# Altium project Bio-Tracking-Device.PrjPcb (part 2 of 4)

## Sheet GSM-Sheet.SchDoc
size 420 x 297 mm; SheetNumber: 5; SheetTotal: 6
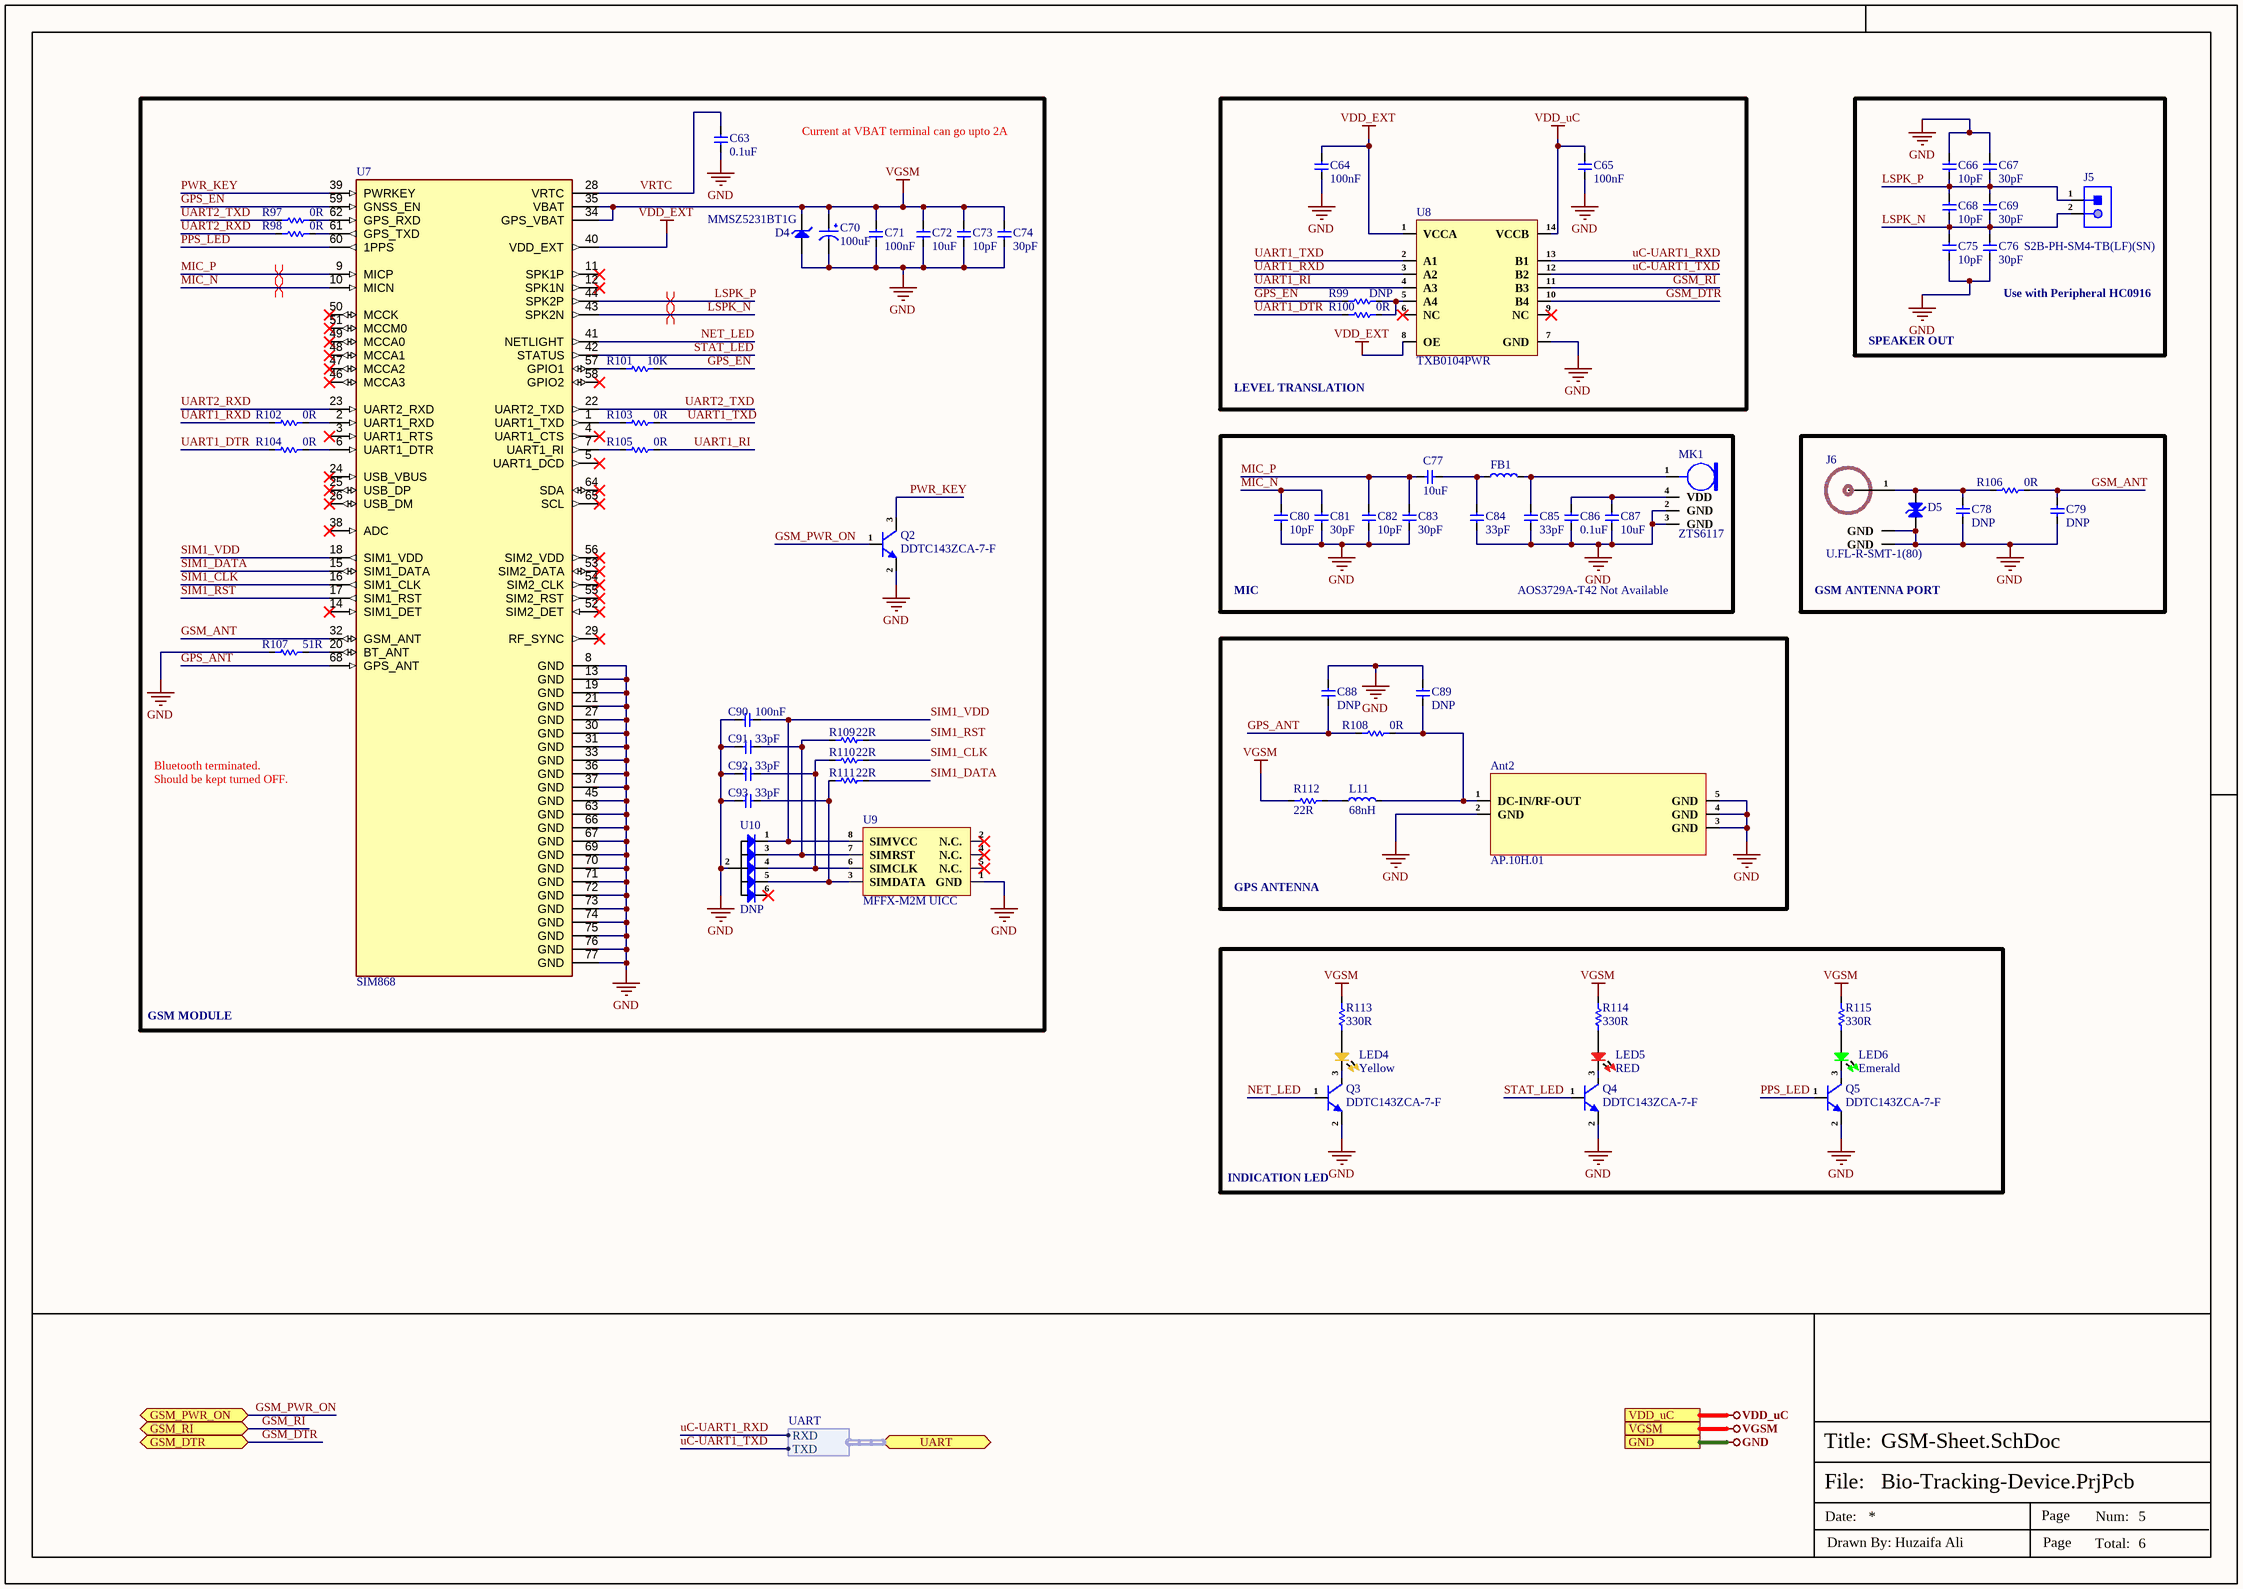
[diagram p2: GSM-Sheet.SchDoc]

### Parts
Ant2  AP.10H.01  [AP.10H.01]
C63  0.1uF  [Cap-0402]
C64  100nF  [Cap-0402]
C65  100nF  [Cap-0402]
C66  10pF  [Cap-0402]
C67  30pF  [Cap-0402]
C68  10pF  [Cap-0402]
C69  30pF  [Cap-0402]
C70  100uF  [Case-B]
C71  100nF  [Cap-0402]
C72  10uF  [CAP-0603]
C73  10pF  [Cap-0402]
C74  30pF  [Cap-0402]
C75  10pF  [Cap-0402]
C76  30pF  [Cap-0402]
C77  10uF  [Cap-0402]
C78  DNP  [CAP-0201]
C79  DNP  [CAP-0201]
C80  10pF  [Cap-0402]
C81  30pF  [Cap-0402]
C82  10pF  [Cap-0402]
C83  30pF  [Cap-0402]
C84  33pF  [Cap-0402]
C85  33pF  [Cap-0402]
C86  0.1uF  [Cap-0402]
C87  10uF  [Cap-0402]
C88  DNP  [CAP-0201]
C89  DNP  [CAP-0201]
C90  100nF  [Cap-0402]
C91  33pF  [Cap-0402]
C92  33pF  [Cap-0402]
C93  33pF  [Cap-0402]
D4  MMSZ5231BT1G  [SOD-123]
D5  LXES15AAA1-153  [DFN1006-2L (Bi-Directional)]  (value not drawn)
FB1  100MHz  [IND-0402]  (value not drawn)
J5  S2B-PH-SM4-TB(LF)(SN)  [S2B-PH-SM4-TB(LF)(SN)]
J6  U.FL-R-SMT-1(80)  [U.FL-R-SMT-1(80)_]
L11  68nH  [IND-0603 (1608 Metric)]
LED4  Yellow  [LED-0603]
LED5  RED  [LED-0603]
LED6  Emerald  [LED-0603]
MK1  ZTS6117  [ZTS6117_]
Q2  DDTC143ZCA-7-F  [SOT-23]
Q3  DDTC143ZCA-7-F  [SOT-23]
Q4  DDTC143ZCA-7-F  [SOT-23]
Q5  DDTC143ZCA-7-F  [SOT-23]
R97  0R  [Res-0201]
R98  0R  [Res-0201]
R99  DNP  [Res-0402]
R100  0R  [Res-0201]
R101  10K  [Res-0402]
R102  0R  [Res-0201]
R103  0R  [Res-0201]
R104  0R  [Res-0201]
R105  0R  [Res-0201]
R106  0R  [Res-0201]
R107  51R  [RES-0805]
R108  0R  [Res-0201]
R109  22R  [Res-0402]
R110  22R  [Res-0402]
R111  22R  [Res-0402]
R112  22R  [Res-0402]
R113  330R  [Res-0402]
R114  330R  [Res-0402]
R115  330R  [Res-0402]
U7  SIM868  [XCVR_SIM868]
U8  TXB0104PWR  [14-TSSOP]
U9  MFFX-M2M UICC  [MFFX]
U10  DNP  [SOT-363]

### Blocks framed on the sheet
LEVEL TRANSLATION: C64 C65 R99 R100 U8
GSM ANTENNA PORT: C78 C79 D5 J6 R106
GPS ANTENNA: Ant2 C88 C89 L11 R108 R112
INDICATION LED: LED4-LED6 Q3-Q5 R113-R115

### Ports
GND (see Top-Sheet[2B], Controller-Sheet[5D], Power-Sheet[5D], Sensor-Sheet[5D], Temp-Sensor-Sheet[3D]), GSM_DTR (bidir, see Top-Sheet[2B], Controller-Sheet[1D]), GSM_PWR_ON (bidir, see Top-Sheet[2B], Controller-Sheet[1D]), GSM_RI (bidir, see Top-Sheet[2B], Controller-Sheet[1D]), UART (bidir, harness UART, see Top-Sheet[2B], Controller-Sheet[4D]), VDD_uC (see Top-Sheet[2B], Controller-Sheet[5D], Power-Sheet[5D]), VGSM (see Top-Sheet[2B], Power-Sheet[5D])

### Harnesses
UART: RXD, TXD

### Nets
GND: Ant2.2(GND) Ant2.3(GND) Ant2.4(GND) Ant2.5(GND) C63.1 C64.1 C65.1 C66.2 C67.2 C70.2 C71.1 C72.1 C73.1 C74.1 C75.1 C76.1 C78.1 C79.1 C80.1 C81.1 C82.1 C83.1 C84.1 C85.1 C86.1 C87.1 C88.2 C89.2 C90.1 C91.2 C92.2 C93.2 D4.1(A) D5.1(A) J6.2(GND) J6.3(GND) MK1.2(GND) MK1.3(GND) Q2.2(E) Q3.2(E) Q4.2(E) Q5.2(E) R107.1 U7.8(GND) U7.13(GND) U7.19(GND) U7.21(GND) U7.27(GND) U7.30(GND) U7.31(GND) U7.33(GND) U7.36(GND) U7.37(GND) U7.45(GND) U7.63(GND) U7.66(GND) U7.67(GND) U7.69(GND) U7.70(GND) U7.71(GND) U7.72(GND) U7.73(GND) U7.74(GND) U7.75(GND) U7.76(GND) U7.77(GND) U8.7(GND) U9.1(GND) U10.2(A) ; port GND
VDD_EXT: C64.2 U7.40(VDD_EXT) U8.1(VCCA) U8.8(OE)
VDD_uC: C65.2 U8.14(VCCB) ; port VDD_uC
VGSM: C70.1 C71.2 C72.2 C73.2 C74.2 D4.2(K) R112.1 R113.2 R114.2 R115.2 U7.34(GPS_VBAT) U7.35(VBAT) ; port VGSM
GPS_ANT: C88.1 R108.1 U7.68(GPS_ANT)
GPS_EN: R99.1 R101.2 U7.59(GNSS_EN)
GSM_ANT: C79.2 R106.2 U7.32(GSM_ANT)
GSM_DTR: U8.10(B4) ; port GSM_DTR
GSM_PWR_ON: Q2.1(B) ; port GSM_PWR_ON
GSM_RI: U8.11(B3) ; port GSM_RI
LSPK_N: C68.1 C69.1 C75.2 C76.2 J5.2 U7.43(SPK2N)
LSPK_P: C66.1 C67.1 C68.2 C69.2 J5.1 U7.44(SPK2P)
MIC_N: C80.2 C81.2 U7.10(MICN)
MIC_P: C77.2 C82.2 C83.2 U7.9(MICP)
NET_LED: Q3.1(B) U7.41(NETLIGHT)
PPS_LED: Q5.1(B) U7.60(1PPS)
PWR_KEY: Q2.3(C) U7.39(PWRKEY)
SIM1_CLK: R110.2 U7.16(SIM1_CLK)
SIM1_DATA: R111.2 U7.15(SIM1_DATA)
SIM1_RST: R109.2 U7.17(SIM1_RST)
SIM1_VDD: C90.2 U7.18(SIM1_VDD) U9.8(SIMVCC) U10.1(IO1)
STAT_LED: Q4.1(B) U7.42(STATUS)
UART1_DTR: R100.1 R104.1
UART1_RI: R105.2 U8.4(A3)
UART1_RXD: R102.1 U8.3(A2)
UART1_TXD: R103.2 U8.2(A1)
UART2_RXD: R98.1 U7.23(UART2_RXD)
UART2_TXD: R97.1 U7.22(UART2_TXD)
uC-UART1_RXD: U8.13(B1) ; port UART.RXD
uC-UART1_TXD: U8.12(B2) ; port UART.TXD
VRTC: C63.2 U7.28(VRTC)
NetAnt2_1: Ant2.1(DC-IN/RF-OUT) C89.1 L11.2 R108.2
NetC77_1: C77.1 C84.2 FB1.1
NetC78_2: C78.2 D5.2(A) J6.1(RF_IN) R106.1
NetC85_2: C85.2 FB1.2 MK1.1(OUT)
NetC86_2: C86.2 C87.2 MK1.4(VDD)
NetC91_1: C91.1 R109.1 U9.7(SIMRST) U10.3(IO2)
NetC92_1: C92.1 R110.1 U9.6(SIMCLK) U10.4(IO3)
NetC93_1: C93.1 R111.1 U9.3(SIMDATA) U10.5(IO4)
NetL11_1: L11.1 R112.2
NetLED4_1: LED4.1 R113.1
NetLED4_2: LED4.2 Q3.3(C)
NetLED5_1: LED5.1 R114.1
NetLED5_2: LED5.2 Q4.3(C)
NetLED6_1: LED6.1 R115.1
NetLED6_2: LED6.2 Q5.3(C)
NetR97_2: R97.2 U7.62(GPS_RXD)
NetR98_2: R98.2 U7.61(GPS_TXD)
NetR99_2: R99.2 R100.2 U8.5(A4)
NetR101_1: R101.1 U7.57(GPIO1)
NetR102_2: R102.2 U7.2(UART1_RXD)
NetR103_1: R103.1 U7.1(UART1_TXD)
NetR104_2: R104.2 U7.6(UART1_DTR)
NetR105_1: R105.1 U7.7(UART1_RI)
NetR107_2: R107.2 U7.20(BT_ANT)

Not connected (* = marked no-connect by the designer): U7 3(UART1_RTS)* 4(UART1_CTS)* 5(UART1_DCD)* 11(SPK1P)* 12(SPK1N)* 14(SIM1_DET)* 24(USB_VBUS)* 25(USB_DP)* 26(USB_DM)* 29(RF_SYNC)* 38(ADC)* 46(MCCA3)* 47(MCCA2)* 48(MCCA1)* 49(MCCA0)* 50(MCCK)* 51(MCCM0)* 52(SIM2_DET)* 53(SIM2_DATA)* 54(SIM2_CLK)* 55(SIM2_RST)* 56(SIM2_VDD)* 58(GPIO2)* 64(SDA)* 65(SCL)*; U8 6(NC)* 9(NC)*; U9 2(N.C.)* 4(N.C.)* 5(N.C.)*; U10 6(IO5)*

### Layout directives
differential pair; net class SPK; differential pair class SPK_Pair: LSPK_N, LSPK_P
differential pair; net class MIC; differential pair class MIC_Pair: MIC_N, MIC_P

### Notes on the sheet
- Current at VBAT terminal can go upto 2A
- (near C76) Use with Peripheral HC0916
- SPEAKER OUT
- MIC
- AOS3729A-T42 Not Available
- Bluetooth terminated.
- (near U7) Should be kept turned OFF.
- GSM MODULE
- File:
- Title:
- Date:
- Page
- Num:
- Total:
- Drawn By: Huzaifa Ali

### Library data of the parts
Ant2 = AP.10H.01: RF ANT 1.575GHZ CER PATCH SLD; Manufacturer: Taoglas; Item Type: RF Antennas; Supplier: Digikey; Supplier Part Number: 931-1150-1-ND; Manufacturer Part Number: AP.10H.01; RoHS: Yes; Stock: 996; Pricing: 1=23.02, 100=17.71 (USD); ComponentLink1URL: https://datasheet.ciiva.com/4432/ap-10h-01-19479-4432605.pdf?src-supplier=Mouser; ComponentLink1Description: https://datasheet.ciiva.com/4432/ap-10h-01-19479-4432605.pdf?src-supplier=Mouser; ComponentLink2URL: https://datasheet.ciiva.com/2792/ap-10h-01-2792858.pdf?src-supplier=Digikey; ComponentLink2Description: https://datasheet.ciiva.com/2792/ap-10h-01-2792858.pdf?src-supplier=Digikey; ComponentLink3URL: https://datasheet.ciiva.com/2792/ap-10h-01-2792859.pdf?src-supplier=Digikey; ComponentLink3Description: https://datasheet.ciiva.com/2792/ap-10h-01-2792859.pdf?src-supplier=Digikey; ComponentLink4URL: https://datasheet.ciiva.com/2792/ap-10h-01-2792860.pdf?src-supplier=Digikey; ComponentLink4Description: https://datasheet.ciiva.com/2792/ap-10h-01-2792860.pdf?src-supplier=Digikey
C63 C86 = GRM155R71C104KA88D: CAP CER 0.1UF 16V X7R 0402; Manufacturer: Murata; Material: Ceramic; Value: 100nF; Tolerance: 10%; Insulation Resistance: 10GR; Item Type: Capacitor; Supplier 1: Arrow Electronics; Manufacturer Part Number: GRM155R71C104KA88D; RoHS: Yes; Category: Ceramic Capacitors; Stock 1: 1690322; Pricing 1: 10000=0.00480, 30000=0.00470, 100000=0.00350, 250000=0.00330 (USD); Mounting Technology: Surface Mount; Case/Package: 0402; Pins: 2; Case Code (Metric): 1005; Case Code (Imperial): 0402; Dielectric Material: Ceramic; Min Operating Temperature: -55°C; Max Operating Temperature: 125°C; Voltage Rating: 16V; Packaging: Tape and Reel; Voltage Rating (DC): 16V; Package Quantity: 1; Dielectric: X7R; Termination: SMD/SMT; Voltage: 16V; Series: GRM; Length: 1mm; Width: 0.02inch; Height: 0.5mm; Thickness: 0.022inch; Depth: 0.5mm; Radiation Hardening: No; Lead Free: Lead Free; RoHS Compliant: Yes; ComponentLink1URL: https://datasheet.ciiva.com/129/grm155r71c104ka88-01-129739.pdf?src-supplier=Digi-Key; ComponentLink1Description: https://datasheet.ciiva.com/129/grm155r71c104ka88-01-129739.pdf?src-supplier=Digi-Key; ComponentLink2URL: https://datasheet.ciiva.com/129/grm155r71c104ka88-01-129740.pdf?src-supplier=Digi-Key; ComponentLink2Description: https://datasheet.ciiva.com/129/grm155r71c104ka88-01-129740.pdf?src-supplier=Digi-Key; ComponentLink3URL: https://datasheet.ciiva.com/18102/getdatasheetpartid-85307-18102905.pdf?src-supplier=Verical; ComponentLink3Description: https://datasheet.ciiva.com/18102/getdatasheetpartid-85307-18102905.pdf?src-supplier=Verical; ComponentLink4URL: https://datasheet.ciiva.com/29199/454098-da-01-en-vs-kondensator-0402-29199799.pdf?src-supplier=Conrad; ComponentLink4Description: https://datasheet.ciiva.com/29199/454098-da-01-en-vs-kondensator-0402-29199799.pdf?src-supplier=Conrad; ComponentLink5URL: https://datasheet.ciiva.com/7937/4360-7937615.pdf?src-supplier=Element14; ComponentLink5Description: https://datasheet.ciiva.com/7937/4360-7937615.pdf?src-supplier=Element14; ComponentLink6URL: https://datasheet.ciiva.com/14116/grmseries-highdielectrictype-eng-14116878.pdf?src-supplier=Distrelec; ComponentLink6Description: https://datasheet.ciiva.com/14116/grmseries-highdielectrictype-eng-14116878.pdf?src-supplier=Distrelec; ComponentLink7URL: https://datasheet.ciiva.com/14103/grmseries-highdielectrictype-eng-14103750.pdf?src-supplier=Distrelec; ComponentLink7Description: https://datasheet.ciiva.com/14103/grmseries-highdielectrictype-eng-14103750.pdf?src-supplier=Distrelec; ComponentLink8URL: https://datasheet.ciiva.com/28534/4360-28534127.pdf?src-supplier=Element14; ComponentLink8Description: https://datasheet.ciiva.com/28534/4360-28534127.pdf?src-supplier=Element14; ComponentLink9URL: https://datasheet.ciiva.com/28534/4360-28534133.pdf?src-supplier=Element14; ComponentLink9Description: https://datasheet.ciiva.com/28534/4360-28534133.pdf?src-supplier=Element14; ComponentLink10URL: https://datasheet.ciiva.com/16199/product-16199000.pdf?src-supplier=Future+Electronics; ComponentLink10Description: https://datasheet.ciiva.com/16199/product-16199000.pdf?src-supplier=Future+Electronics; Supplier Part Number 1: GRM155R71C104KA88D; LCSC Part Number: C71629
C64 C65 C71 C90 = 0402F104M500NT: 50V 100nF Y5V ±20% 0402 Multilayer Ceramic Capacitors MLCC - SMD/SMT ROHS; Manufacturer: FH; LCSC Part Number: C1581; Manufacturer Part Number: 0402F104M500NT; Value: 100nF; Item Type: Capacitor; ComponentLink1Description: LCSC; ComponentLink1URL: https://lcsc.com/product-detail/Multilayer-Ceramic-Capacitors-MLCC-SMD-SMT_FH-Guangdong-Fenghua-Advanced-Tech-0402F104M500NT_C1581.html
C66 C68 C73 C75 C80 C82 = GRM1555C1H100JA01D: CAP CER 10PF 50V C0G/NP0 0402; Manufacturer: Murata; Material: Ceramic; Dielectric: C0G; Tolerance: 5%; Item Type: Capacitor; Supplier: Arrow Electronics; Supplier Part Number: GRM1555C1H100JA01D; Manufacturer Part Number: GRM1555C1H100JA01D; RoHS: Yes; Category: Ceramic Capacitors; Stock: 3860000; Pricing: 10000=0.0034, 50000=0.0027, 100000=0.0023, 250000=0.0021 (USD); Mounting Technology: Surface Mount; Case/Package: 0402; Case Code (Metric): 1005; Case Code (Imperial): 0402; Min Operating Temperature: -55°C; Max Operating Temperature: 125°C; Value: 10pF; Voltage Rating: 50V; Packaging: Tape and Reel; Package Quantity: 1; Voltage Rating (DC): 50V; Termination: SMD/SMT; Series: GRM; Voltage: 50V; Construction: Flat; Length: 1mm; Width: 0.02inch; Height: 0.5mm; Depth: 0.5mm; Thickness: 0.022inch; Radiation Hardening: No; RoHS Compliant: Yes; Lead Free: Lead Free; Reach SVHC Compliant: No; ComponentLink1URL: https://datasheet.ciiva.com/2989/product-2989280.pdf?src-supplier=Avnet; ComponentLink1Description: https://datasheet.ciiva.com/2989/product-2989280.pdf?src-supplier=Avnet; ComponentLink2URL: https://datasheet.ciiva.com/18184/getdatasheetpartid-307234-18184164.pdf?src-supplier=Verical; ComponentLink2Description: https://datasheet.ciiva.com/18184/getdatasheetpartid-307234-18184164.pdf?src-supplier=Verical; ComponentLink3URL: https://datasheet.ciiva.com/29200/453545-da-01-en-vs-kondensator-0402-29200107.pdf?src-supplier=Conrad; ComponentLink3Description: https://datasheet.ciiva.com/29200/453545-da-01-en-vs-kondensator-0402-29200107.pdf?src-supplier=Conrad; ComponentLink4URL: https://datasheet.ciiva.com/7828/1666664-7828812.pdf?src-supplier=Element14; ComponentLink4Description: https://datasheet.ciiva.com/7828/1666664-7828812.pdf?src-supplier=Element14; ComponentLink5URL: https://datasheet.ciiva.com/6271/partnumbering-e-01-6271159.pdf?src-supplier=Digi-Key; ComponentLink5Description: https://datasheet.ciiva.com/6271/partnumbering-e-01-6271159.pdf?src-supplier=Digi-Key; ComponentLink6URL: https://datasheet.ciiva.com/6271/partnumbering-e-01-6271158.pdf?src-supplier=Digi-Key; ComponentLink6Description: https://datasheet.ciiva.com/6271/partnumbering-e-01-6271158.pdf?src-supplier=Digi-Key; ComponentLink7URL: https://datasheet.ciiva.com/6271/partnumbering-e-01-6271068.pdf?src-supplier=Digi-Key; ComponentLink7Description: https://datasheet.ciiva.com/6271/partnumbering-e-01-6271068.pdf?src-supplier=Digi-Key; LCSC Part Number: C76946
C67 C69 C74 C76 C81 C83 = CC0402JRNPO9BN300: CAP CER 30PF 50V C0G/NPO 0402; Manufacturer: Yageo; Temperature Coefficient: 30ppm/°C; Item Type: Capacitor; Supplier 1: Future Electronics; Manufacturer Part Number: CC0402JRNPO9BN300; RoHS: Yes; Category: Ceramic Capacitors; Stock 1: 540000; Pricing 1: 10000=0.0025, 40000=0.0024, 150000=0.0023, 400000=0.0022, 1000000=0.0021 (USD); Halogen Free: 5694HalogenFree; ComponentLink1URL: https://datasheet.ciiva.com/13263/upy-gp-np0-16v-to-50v-8-3714-13263961.pdf?src-supplier=Mouser; ComponentLink1Description: https://datasheet.ciiva.com/13263/upy-gp-np0-16v-to-50v-8-3714-13263961.pdf?src-supplier=Mouser; Supplier Part Number 1: 6784771
C70 = TAJB107M010RNJ: CAP TANT 100UF 20% 10V 1411; Manufacturer: Kyocera AVX; Dielectric Material: Tantalum; Tolerance: 10%; ESR (Equivalent Series Resistance): 1.4R; Leakage Current: 10uA; Dissipation Factor: 8%; Item Type: Capacitor; Supplier 1: Rs; Manufacturer Part Number: TAJB107M010RNJ; RoHS: Yes; Category: Tantalum Capacitors; Stock 1: 17520; Pricing 1: 2000=0.302 (GBP); Mounting Technology: Surface Mount; Case/Package: 1210; Case Code (Imperial): 1210; Case Code (Metric): 3528; Min Operating Temperature: -55°C; Max Operating Temperature: 125°C; Value: 100uF; Voltage Rating (DC): 10V; Series: TAJ; Construction: Flat; Voltage Rating: 10V; Package Quantity: 2000; Packaging: Tape and Reel; Termination: SMD/SMT; Voltage: 10V; Features: General Purpose; Length: 3.5mm; Width: 2.8mm; Height: 2.1mm; Depth: 2.8mm; Radiation Hardening: No; Lead Free: Lead Free; RoHS Compliant: Yes; Reach SVHC Compliant: No; ComponentLink1URL: https://datasheet.ciiva.com/264/taj-264281.pdf?src-supplier=Digi-Key; ComponentLink1Description: https://datasheet.ciiva.com/264/taj-264281.pdf?src-supplier=Digi-Key; ComponentLink2URL: https://datasheet.ciiva.com/264/taj-264280.pdf?src-supplier=Digi-Key; ComponentLink2Description: https://datasheet.ciiva.com/264/taj-264280.pdf?src-supplier=Digi-Key; ComponentLink3URL: https://datasheet.ciiva.com/264/taj-264282.pdf?src-supplier=Digi-Key; ComponentLink3Description: https://datasheet.ciiva.com/264/taj-264282.pdf?src-supplier=Digi-Key; ComponentLink4URL: https://datasheet.ciiva.com/11225/taj-11225964.pdf?src-supplier=Avnet; ComponentLink4Description: https://datasheet.ciiva.com/11225/taj-11225964.pdf?src-supplier=Avnet; ComponentLink5URL: https://datasheet.ciiva.com/11225/taj-11225963.pdf?src-supplier=Avnet; ComponentLink5Description: https://datasheet.ciiva.com/11225/taj-11225963.pdf?src-supplier=Avnet; Supplier Part Number 1: 1354069; LCSC Part Number: C7196
C72 = TMK107BBJ106MA-T: CAP CER 10UF 25V X5R 0603; Manufacturer: Taiyo Yuden; Tolerance: 20%; Supplier 1: Digi-Key; Manufacturer Part Number: TMK107BBJ106MA-T; Stock 1: 85333; Pricing 1: 1=0.46, 10=0.32, 50=0.2238, 100=0.1918, 500=0.14386, 1000=0.12149 (USD); Mount: Surface Mount; Case/Package: 0603; Case Code (Imperial): 0603; Case Code (Metric): 1608; Min Operating Temperature: -55°C; Max Operating Temperature: 85°C; Packaging: Tape and Reel; Capacitance: 10uF; Voltage Rating: 25V; Lead Free: Lead Free; RoHS Compliant: Yes; ComponentLink1URL: http://ds.yuden.co.jp/TYCOMPAS/ut/detail.do?productNo=TMK107BBJ106MA-T&fileName=TMK107BBJ106MA-T_SS&mode=specSheetDownload&src-supplier=Digi-Key; ComponentLink1Description: http://ds.yuden.co.jp/TYCOMPAS/ut/detail.do?productNo=TMK107BBJ106MA-T&fileName=TMK107BBJ106MA-T_SS&mode=specSheetDownload&src-supplier=Digi-Key; Supplier Part Number 1: 587-6023-1-ND; LCSC Part Number: C386081
C77 C87 = GRM155R61A106ME44D: 10V 10uF X5R ±20% 0402 Multilayer Ceramic Capacitors MLCC - SMD/SMT ROHS; Manufacturer: Murata; Dielectric: 1537DielectricType; Supplier: LCSC; LCSC Part Number: C77000; Manufacturer Part Number: GRM155R61A106ME44D; RoHS: Yes; Item Type: Capacitors; Stock: 574805; Pricing: 50=0.0103, 500=0.008, 1500=0.0068, 10000=0.0056, 50000=0.0055 (USD); Case/Package: 343Case; Value: 10uF; Voltage Rating (DC): 10V; Length: 1mm; Width: 500um; Thickness: 500um
C78 C79 C88 C89 = GRM0335C1E2R0BA01D: CAP CER 2PF 25V C0G/NP0 0201; Manufacturer: Murata; Item Type: Capacitor; Supplier 1: Arrow Electronics; Manufacturer Part Number: GRM0335C1E2R0BA01D; RoHS: Yes; Category: Ceramic Capacitors; Stock 1: 65754; Pricing 1: 1=0.053, 10=0.0058, 25=0.004, 100=0.0026, 500=0.0024, 1000=0.0023, 3000=0.0022, 6000=0.0021, 15000=0.002, 30000=0.0019 (USD); ComponentLink1URL: https://datasheet.ciiva.com/29535/grm0335c1e2r0ba01-01-29535294.pdf?src-supplier=Digi-Key; ComponentLink1Description: https://datasheet.ciiva.com/29535/grm0335c1e2r0ba01-01-29535294.pdf?src-supplier=Digi-Key; Supplier Part Number 1: GRM0335C1E2R0BA01D; LCSC Part Number: C161383
C84 C85 C91-C93 = GRM1555C1E330JA01D: CAP CER 33PF 25V C0G/NP0 0402; Manufacturer: Murata; Tolerance: 5%; Dielectric: C0G; Item Type: Capacitor; Supplier 1: Digi-Key; Manufacturer Part Number: GRM1555C1E330JA01D; Stock 1: 250773; Pricing 1: 1=0.1, 10=0.034, 50=0.0184, 100=0.0151, 500=0.01078, 1000=0.00847, 2500=0.0077, 5000=0.00708 (USD); Mount: Surface Mount; Case/Package: 0402; Case Code (Metric): 1005; Case Code (Imperial): 0402; Min Operating Temperature: -55°C; Max Operating Temperature: 125°C; Capacitance: 33pF; Package Quantity: 1; Voltage Rating: 25V; Packaging: Tape and Reel; Voltage Rating (DC): 25V; Termination: SMD/SMT; Voltage: 25V; Series: GRM; Construction: Flat; Length: 1mm; Width: 0.02inch; Height: 0.5mm; Thickness: 0.022inch; Depth: 0.5mm; Radiation Hardening: No; Lead Free: Lead Free; RoHS Compliant: Yes; ComponentLink1URL: https://www.murata.com/~/media/webrenewal/support/library/catalog/products/capacitor/mlcc/c02e.ashx?la=en-us&src-supplier=Digi-Key; ComponentLink1Description: https://www.murata.com/~/media/webrenewal/support/library/catalog/products/capacitor/mlcc/c02e.ashx?la=en-us&src-supplier=Digi-Key; ComponentLink2URL: http://www.mouser.com/ds/2/281/c02e-2905.pdf?src-supplier=Mouser; ComponentLink2Description: http://www.mouser.com/ds/2/281/c02e-2905.pdf?src-supplier=Mouser; ComponentLink3URL: http://psearch.murata.com/capacitor/product/GRM1555C1E330JA01%23.pdf?src-supplier=Avnet; ComponentLink3Description: http://psearch.murata.com/capacitor/product/GRM1555C1E330JA01%23.pdf?src-supplier=Avnet; Supplier Part Number 1: 490-6177-1-ND; LCSC Part Number: C441758
D4 = MMSZ5231BT1G: DIODE ZENER 5.1V 500MW SOD123; Manufacturer: ON Semiconductor; Material: Plastic; Max Reverse Leakage Current: 5uA; Impedance: 17R; Tolerance: 5%; Zener Current: 10mA; Test Current: 20mA; Forward Voltage: 900mV; Breakdown Voltage: 5.36V; Supplier 1: Allied Electronics; Manufacturer Part Number: MMSZ5231BT1G; RoHS: Yes; Category: Zener Diodes; Case/Package: SOD-123-2; Pins: 2; Min Operating Temperature: -55°C; Max Operating Temperature: 150°C; Max Power Dissipation: 500mW; Packaging: Tape and Reel; Zener Voltage: 5.1V; Package Quantity: 3000; Series: Automotive, AEC-Q101; Voltage Tolerance: 5%; Power Dissipation: 500mW; Working Voltage: 5.1V; Max Reverse Current: 5uA; Voltage Rating (DC): 5.1V; Power Rating: 500mW; Length: 2.69mm; Width: 1.6mm; Height: 1.12mm; RoHS Compliant: Yes; Lead Free: Lead Free; Reach SVHC Compliant: No; ComponentLink1URL: https://datasheet.ciiva.com/23815/1708301-23815376.pdf?src-supplier=Newark; ComponentLink1Description: https://datasheet.ciiva.com/23815/1708301-23815376.pdf?src-supplier=Newark; ComponentLink2URL: https://datasheet.ciiva.com/22626/1708301-22626967.pdf?src-supplier=Element14; ComponentLink2Description: https://datasheet.ciiva.com/22626/1708301-22626967.pdf?src-supplier=Element14; ComponentLink3URL: https://datasheet.ciiva.com/4731/mmsz5221bt1-d-4731452.pdf?src-supplier=Mouser; ComponentLink3Description: https://datasheet.ciiva.com/4731/mmsz5221bt1-d-4731452.pdf?src-supplier=Mouser; ComponentLink4URL: https://datasheet.ciiva.com/16200/mmsz5221bt1-d-16200104.pdf?src-supplier=Future+Electronics; ComponentLink4Description: https://datasheet.ciiva.com/16200/mmsz5221bt1-d-16200104.pdf?src-supplier=Future+Electronics; ComponentLink5URL: https://datasheet.ciiva.com/894/mmsz5221bt1-d-894882.pdf?src-supplier=Digi-Key; ComponentLink5Description: https://datasheet.ciiva.com/894/mmsz5221bt1-d-894882.pdf?src-supplier=Digi-Key; ComponentLink6URL: https://datasheet.ciiva.com/894/mmsz5221bt1-d-894883.pdf?src-supplier=Digi-Key; ComponentLink6Description: https://datasheet.ciiva.com/894/mmsz5221bt1-d-894883.pdf?src-supplier=Digi-Key; ComponentLink7URL: https://datasheet.ciiva.com/894/mmsz5221bt1-d-894881.pdf?src-supplier=Digi-Key; ComponentLink7Description: https://datasheet.ciiva.com/894/mmsz5221bt1-d-894881.pdf?src-supplier=Digi-Key; Supplier Part Number 1: 70099546; LCSC Part Number: C66198; Item Type: Diode
D5 = LXES15AAA1-153: 40V Bidirectional 5V DFN1006-2 ESD and Surge Protection (TVS/ESD) ROHS; Manufacturer: TECH PUBLIC; Manufacturer Part Number: LXES15AAA1-153; Package: DFN1006-2; LCSC Part Number: C7472903; Item Type: (TVS/ESD); ComponentLink1Description: LCSC; ComponentLink1URL: https://www.lcsc.com/product-detail/ESD-and-Surge-Protection-TVS-ESD_TECH-PUBLIC-LXES15AAA1-153_C7472903.html
FB1 = MFBM1V1005-102-R: FERRITE BEAD 1 OHM 0402 1LN; Manufacturer: Eaton Bussmann; Supplier: Arrow Electronics; Supplier Part Number: MFBM1V1005-102-R; Manufacturer Part Number: MFBM1V1005-102-R; RoHS: No; Category: Ferrite Beads and Chips; Stock: 60000; Pricing: 10000=0.0074, 30000=0.0072, 50000=0.0067 (USD); ComponentLink1URL: https://datasheet.octopart.com/MFBM1V1005-102-R-Cooper-Bussmann-datasheet-147669133.pdf?src-supplier=Sager+Electronics; ComponentLink1Description: https://datasheet.octopart.com/MFBM1V1005-102-R-Cooper-Bussmann-datasheet-147669133.pdf?src-supplier=Sager+Electronics; Item Type: Ferrite Bead
J5 = S2B-PH-SM4-TB(LF)(SN): CONN HEADER SMD R/A 2POS 2MM; Manufacturer: JST; Item Type: Connectors; Voltage Rating: 100V; Current Rating: 3A; Insulation Resistance: 1GR; Number of Positions: 2; Gender: 29Gender; Number of Contacts: 2NUMBER; Max Current Rating: 2A; Contact Resistance: 20mR; Supplier: Future Electronics; LCSC Part Number: C295747; Manufacturer Part Number: S2B-PH-SM4-TB(LF)(SN); RoHS: No; Stock: 5000; Pricing: 1000=0.27, 2000=0.265, 3000=0.265, 4000=0.26, 5000=0.25 (USD); Mounting Technology: Surface Mount; Pins: 2NUMBER; Contact Material: Copper Alloy; Color: 46,47Colour; Contact Plating: 154ConductorMaterial; Housing Color: 50Colour; Housing Material: 4302ConductorMaterial; Weight: 28.349523g; Contact Shape: Square; Contact Finish - Mating: TIN; Insulation Material: Nylon; Insulation Color: Natural; Min Operating Temperature: -25°C; Max Operating Temperature: 85°C; Number of Rows: 1; Termination: Solder; Series: PH; Packaging: Cut Tape; Orientation: 5496OrientationType; Max Voltage Rating (AC): 100V; Voltage Rating (AC): 100V; Working Voltage: 100V; Connector Type: Header; Fastening Type: Detent; Contact Type: Male Pin; Voltage Rating (DC): 100V; Number of Poles: 2NUMBER; Length: 11.9mm; Width: 2.34mm; Height: 6mm; Pitch: 2mm; Depth: 7.6mm; Lead Pitch: 2mm; Contact Mating Length: 3.302mm; Flammability Rating: UL94 V-0; Reach SVHC Compliant: 4186SVHC; Lead Free: 5697LeadFree; ComponentLink1URL: http://www.farnell.com/datasheets/1699381.pdf?src-supplier=Farnell; ComponentLink1Description: http://www.farnell.com/datasheets/1699381.pdf?src-supplier=Farnell; ComponentLink2URL: http://datasheet.octopart.com/S2B-PH-SM4-TB-%28LF%29%28SN%29-JST-datasheet-12510261.pdf?src-supplier=Distrelec; ComponentLink2Description: http://datasheet.octopart.com/S2B-PH-SM4-TB-%28LF%29%28SN%29-JST-datasheet-12510261.pdf?src-supplier=Distrelec; ComponentLink3URL: http://www.farnell.com/datasheets/1699381.pdf?src-supplier=Newark; ComponentLink3Description: http://www.farnell.com/datasheets/1699381.pdf?src-supplier=Newark; ComponentLink4URL: https://datasheet.octopart.com/S2B-PH-SM4-TB%28LF%29%28SN%29-JST-datasheet-56537.pdf?src-supplier=Future+Electronics; ComponentLink4Description: https://datasheet.octopart.com/S2B-PH-SM4-TB%28LF%29%28SN%29-JST-datasheet-56537.pdf?src-supplier=Future+Electronics; ComponentLink5URL: http://www.farnell.com/datasheets/1699381.pdf?src-supplier=Element14; ComponentLink5Description: http://www.farnell.com/datasheets/1699381.pdf?src-supplier=Element14; ComponentLink6URL: https://datasheet.octopart.com/S2B-PH-SM4-TB-%28LF%29%28SN%29-JST-datasheet-12510261.pdf?src-supplier=TME; ComponentLink6Description: https://datasheet.octopart.com/S2B-PH-SM4-TB-%28LF%29%28SN%29-JST-datasheet-12510261.pdf?src-supplier=TME
J6 = U.FL-R-SMT-1(80): CONN U.FL RCPT STR 50 OHM SMD; Manufacturer: Hirose; Item Type: UFL Connector; Supplier 1: Future Electronics; Manufacturer Part Number: U.FL-R-SMT-1(80); Stock 1: 1272; Pricing 1: 1=1.07, 500=0.785, 1500=0.74, 2500=0.72, 5000=0.695 (USD); Case/Package: SMD/SMT; Package Quantity: 10000; Packaging: Tape and Reel; Lead Free: Lead Free; ComponentLink1URL: https://www.hirose.com/product/en/download_file/key_name/U.FL-R-SMT-1%2880%29/category/Specification%20Sheet/doc_file_id/37638/?file_category_id=9&item_id=03310472280&is_series=&src-supplier=Digi-Key; ComponentLink1Description: https://www.hirose.com/product/en/download_file/key_name/U.FL-R-SMT-1%2880%29/category/Specification%20Sheet/doc_file_id/37638/?file_category_id=9&item_id=03310472280&is_series=&src-supplier=Digi-Key; ComponentLink2URL: http://www.mouser.com/ds/2/185/U.FL_catalog-939761.pdf?src-supplier=Mouser; ComponentLink2Description: http://www.mouser.com/ds/2/185/U.FL_catalog-939761.pdf?src-supplier=Mouser; Supplier Part Number 1: U.FL-R-SMT-1(80)-CUTT; LCSC Part Number: C88374
L11 = 0603CS-68NXJLW: Ind Chip Wirewound 68nH 5% 200MHz 37Q-Factor Ceramic 600mA 0603; Manufacturer: Coilcraft; DC Resistance (DCR): 340mR; Q Factor: 21; Self Resonant Frequency: 1.7GHz; Item Type: Inductor; Supplier 1: Mouser; Manufacturer Part Number: 0603CS-68NXJLW; RoHS: Yes; Category: Fixed Inductors; Stock 1: 3257; Pricing 1: 1=0.96000, 10=0.95200, 50=0.95200, 100=0.95200, 1000=0.36200, 10000=0.30900 (USD); Case/Package: 0603; Weight: 7.1E-05oz; Core Material: Ceramic; Min Operating Temperature: -40°C; Max Operating Temperature: 125°C; Packaging: Tape and Reel; Tolerance: 5%; Inductance: 68nH; Max DC Current: 600mA; Termination: SMD/SMT; Test Frequency: 200MHz; Series: 0603CS; Length: 1.8mm; Width: 1.12mm; Height: 1.02mm; Lead Free: Contains Lead; RoHS Compliant: Yes; ComponentLink1URL: http://www.mouser.com/ds/2/597/0603cs-270694.pdf?src-supplier=Mouser; ComponentLink1Description: http://www.mouser.com/ds/2/597/0603cs-270694.pdf?src-supplier=Mouser; Supplier Part Number 1: 994-0603CS-68NXJLW
LED4 = NCD0603Y2: yellow 0603 Light Emitting Diodes (LED) ROHS; Manufacturer: Foshan NationStar Optoelectronics; Manufacturer Part Number: NCD0603Y2; Package: 0603; LCSC Part Number: C89811; Item Type: LED; ComponentLink1Description: LCSC; ComponentLink1URL: https://www.lcsc.com/product-detail/Light-Emitting-Diodes-LED_Foshan-NationStar-Optoelectronics-NCD0603Y2_C89811.html
LED5 = NCD0603R3: RED LED 0603 Light Emitting Diodes; Manufacturer: Foshan NationStar Optoelectronics; Manufacturer Part Number: NCD0603R3; Package: 0603; Item Type: LED; LCSC Part Number: C3151730; ComponentLink1Description: LCSC; ComponentLink1URL: https://www.lcsc.com/product-detail/Light-Emitting-Diodes-LED_Foshan-NationStar-Optoelectronics-NCD0603R3_C3151730.html
LED6 = NCD0603G2: Emerald 0603 Light Emitting Diodes (LED) ROHS; Manufacturer: Foshan NationStar Optoelectronics; Manufacturer Part Number: NCD0603G2; Package: 0603; LCSC Part Number: C87326; Item Type: LED; ComponentLink1Description: LCSC; ComponentLink1URL: https://www.lcsc.com/product-detail/Light-Emitting-Diodes-LED_Foshan-NationStar-Optoelectronics-NCD0603G2_C87326.html
MK1 = ZTS6117: 1.5V~3.6V Omnidirectional 120uA -42dB 400Ω 59dB SMD-4P,1.9x2.8mm MEMS Microphones ROHS; Manufacturer: Zilltek; Manufacturer Part Number: ZTS6117; LCSC Part Number: C481300; Item Type: Microphone; ComponentLink1Description: LCSC; ComponentLink1URL: https://www.lcsc.com/product-detail/MEMS-Microphones_ZILLTEK-ZTS6117_C481300.html
Q2-Q5 = DDTC143ZCA-7-F: TRANS PREBIAS NPN 50V SOT23-3; Manufacturer: Diodes; Item Type: BJTs; Supplier: Rs; LCSC Part Number: C508183; Manufacturer Part Number: DDTC143ZCA-7-F; RoHS: Yes; Stock: 6400; Pricing: 1000=0.669, 2000=0.635, 3000=0.445, 6000=0.424 (DKK); ComponentLink1URL: http://uk.rs-online.com/webdocs/1321/0900766b81321d3c.pdf?src-supplier=Rs; ComponentLink1Description: http://uk.rs-online.com/webdocs/1321/0900766b81321d3c.pdf?src-supplier=Rs; ComponentLink2URL: http://components.arrow.com/part/dataview/41508542S9348013N2867?src-supplier=Arrow+Electronics; ComponentLink2Description: http://components.arrow.com/part/dataview/41508542S9348013N2867?src-supplier=Arrow+Electronics; ComponentLink3URL: http://www.mouser.com/ds/2/115/ds30330-71322.pdf?src-supplier=Mouser; ComponentLink3Description: http://www.mouser.com/ds/2/115/ds30330-71322.pdf?src-supplier=Mouser; ComponentLink4URL: http://www.alliedelec.com/m/d/be0b5f6f3c5081911d08f51c92d34358.pdf?src-supplier=Allied+Electronics; ComponentLink4Description: http://www.alliedelec.com/m/d/be0b5f6f3c5081911d08f51c92d34358.pdf?src-supplier=Allied+Electronics; ComponentLink5URL: https://www.diodes.com/assets/Datasheets/ds30330.pdf?src-supplier=Digikey; ComponentLink5Description: https://www.diodes.com/assets/Datasheets/ds30330.pdf?src-supplier=Digikey; ComponentLink6URL: https://datasheet.octopart.com/DDTC143ZCA-7-F-Diodes-Inc.-datasheet-46751235.pdf?src-supplier=Farnell; ComponentLink6Description: https://datasheet.octopart.com/DDTC143ZCA-7-F-Diodes-Inc.-datasheet-46751235.pdf?src-supplier=Farnell; ComponentLink7URL: http://www.diodes.com//datasheets/ds30330.pdf?src-supplier=Avnet; ComponentLink7Description: http://www.diodes.com//datasheets/ds30330.pdf?src-supplier=Avnet; ComponentLink8URL: http://www.diodes.com/_files/datasheets/ds30330.pdf?src-supplier=Future+Electronics; ComponentLink8Description: http://www.diodes.com/_files/datasheets/ds30330.pdf?src-supplier=Future+Electronics
R97 R98 R100 R102-R106 R108 = 0201WMF0000TEE: 50mW Thick Film Resistors 25V ±1% 0Ω 0201 Chip Resistor - Surface Mount ROHS; Manufacturer: UNI-ROYAL; Manufacturer Part Number: 0201WMF0000TEE; Package: 0201; LCSC Part Number: C473473; Item Type: Resistor; ComponentLink1Description: LCSC; ComponentLink1URL: https://www.lcsc.com/product-detail/Chip-Resistor-Surface-Mount_UNI-ROYAL-Uniroyal-Elec-0201WMF0000TEE_C473473.html
R99 R101 = MR04X1002FTL: 100mW Thick Film Resistors 50V ±100ppm/℃ ±1% 10kΩ 0402 Chip Resistor - Surface Mount ROHS; Manufacturer: Walsin Tech Corp; Manufacturer Part Number: MR04X1002FTL; Package: 0402; LCSC Part Number: C327797; Item Type: Resistor; ComponentLink1Description: LCSC; ComponentLink1URL: https://www.lcsc.com/product-detail/Chip-Resistor-Surface-Mount_Walsin-Tech-Corp-MR04X1002FTL_C327797.html
R107 = AC0805FR-7W51RL: RES 51 OHM 1% 1/4W 0805; Manufacturer: Yageo; Item Type: Resistor; Supplier: Digi-Key; Supplier Part Number: 13-AC0805FR-7W51RLTR-ND; Manufacturer Part Number: AC0805FR-7W51RL; RoHS: Yes; Category: Chip SMD Resistors; Pricing: 5000=0.01178 (USD); LCSC Part Number: C727996
R109-R112 = RC0402FR-0722RL: RES 22 OHM 1% 1/16W 0402; Manufacturer: Yageo; Voltage Rating: 50V; Power Rating: 62.5mW; Temperature Coefficient: 100ppm/°C; Max Power Dissipation: 63mW; Item Type: Resistor; Supplier 1: Avnet; Manufacturer Part Number: RC0402FR-0722RL; RoHS: Yes; Category: Chip SMD Resistors; Stock 1: 1810000; Pricing 1: 10000=0.00085 (USD); Case/Package: 0402; Number of Pins: 2; Case Code (Imperial): 0402; Case Code (Metric): 1005; Size Code: 0402; Min Operating Temperature: -55°C; Max Operating Temperature: 155°C; Resistor Type: Thick Film; Voltage Rating (DC): 50V; Resistance: 22R; Tolerance: 1%; Packaging: Tape and Reel; Termination: SMD/SMT; Features: Moisture Resistant; Series: RC; Number of Terminations: 2; Resistance Tolerance: 1%; Technology: THICK FILM; Construction: Rectangular; Length: 1mm; Width: 0.5mm; Height: 0.32mm; Depth: 0.5mm; RoHS Compliant: Yes; Reach SVHC Compliant: Yes; Military Standard: Not; Lead Free: Lead Free; ComponentLink1URL: https://datasheet.ciiva.com/11819/0900766b80c66297-11819462.pdf?src-supplier=RSComponents; ComponentLink1Description: https://datasheet.ciiva.com/11819/0900766b80c66297-11819462.pdf?src-supplier=RSComponents; ComponentLink2URL: https://datasheet.ciiva.com/7849/1018594-7849912.pdf?src-supplier=Element14; ComponentLink2Description: https://datasheet.ciiva.com/7849/1018594-7849912.pdf?src-supplier=Element14; ComponentLink3URL: https://datasheet.ciiva.com/7849/1018594-7849911.pdf?src-supplier=Element14; ComponentLink3Description: https://datasheet.ciiva.com/7849/1018594-7849911.pdf?src-supplier=Element14; ComponentLink4URL: https://datasheet.ciiva.com/16930/pyu-rc0402-51-rohs-l-6-r-16930687.pdf?src-supplier=Future+Electronics; ComponentLink4Description: https://datasheet.ciiva.com/16930/pyu-rc0402-51-rohs-l-6-r-16930687.pdf?src-supplier=Future+Electronics; ComponentLink5URL: https://datasheet.ciiva.com/26829/getdatasheetpartid-554995-26829991.pdf?src-supplier=Verical; ComponentLink5Description: https://datasheet.ciiva.com/26829/getdatasheetpartid-554995-26829991.pdf?src-supplier=Verical; Supplier Part Number 1: RC0402FR-0722RL; LCSC Part Number: C114765
R113-R115 = RK73H1ETTP3300F: RES 330 OHM 1% 1/10W 0402; Manufacturer: KOA Speer; Power Rating: 63mW; Voltage Rating: 50V; Temperature Coefficient: 100ppm/°C; Max Power Dissipation: 100mW; Supplier: Rs; Supplier Part Number: 6317972; Manufacturer Part Number: RK73H1ETTP3300F; RoHS: Yes; Category: Chip SMD Resistors; Stock: 36500; Pricing: 100=0.007, 1000=0.006, 2500=0.006, 5000=0.006, 10000=0.005 (GBP); Case/Package: 0402; Case Code (Imperial): 0402; Case Code (Metric): 1005; Min Operating Temperature: -55°C; Max Operating Temperature: 155°C; Value: 330R; Tolerance: 1%; Packaging: Tape and Reel; Package Quantity: 10000; Termination: SMD/SMT; Voltage Rating (DC): 50V; Series: RK73H; Construction: Rectangular; Features: Moisture Resistant,Automotive AEC-Q200; Number of Terminations: 2; Length: 1mm; Width: 0.5mm; Height: 0.35mm; LCSC Part Number: C159971; Ratings: AEC-Q200; Military Standard: Not; Lead Free: Lead Free; RoHS Compliant: Yes; ComponentLink1URL: https://datasheet.ciiva.com/5555/rk73h-5555909.pdf?src-supplier=Mouser; ComponentLink1Description: https://datasheet.ciiva.com/5555/rk73h-5555909.pdf?src-supplier=Mouser; ComponentLink2URL: https://datasheet.ciiva.com/15203/getdatasheetpartid-424481-15203100.pdf?src-supplier=Verical; ComponentLink2Description: https://datasheet.ciiva.com/15203/getdatasheetpartid-424481-15203100.pdf?src-supplier=Verical
U7 = SIM868: SIM868 GNSS, GSM RF mikroBUSâ„¢ Clickâ„¢ Platform Evaluation Expansion Board; MF: MikroElektronika; Check_prices: https://www.snapeda.com/parts/SIM868/MikroElektronika/view-part/?ref=eda; Value: *; Availability: Not in stock; MP: SIM868; Price: None; Package: None; SnapEDA_Link: https://www.snapeda.com/parts/SIM868/MikroElektronika/view-part/?ref=snap
U8 = TXB0104PWR: 4-Bit Bidirectional Voltage-Level Shifter with Auto Direction Sensing and +/-15 kV ESD Protect 14-TSSOP -40 to 85; Manufacturer: Texas Instruments; Number of Outputs: 4NUMBER; Min Supply Voltage (DC): 1.2V; Item Type: IC; Supplier: Digikey; Supplier Part Number: 296-21929-1-ND; Manufacturer Part Number: TXB0104PWR; RoHS: Yes; Category: Voltage Level Shifters; Stock: 5613; Pricing: 1=0.98, 10=0.878, 25=0.8336, 100=0.6848, 250=0.64012, 500=0.56568, 1000=0.44659 (USD); Thickness: 1mm; ComponentLink1URL: https://datasheet.ciiva.com/15096/getdatasheetpartid-48026-15096134.pdf?src-supplier=Verical; ComponentLink1Description: https://datasheet.ciiva.com/15096/getdatasheetpartid-48026-15096134.pdf?src-supplier=Verical; ComponentLink2URL: https://datasheet.ciiva.com/22653/1845221-22653354.pdf?src-supplier=Farnell; ComponentLink2Description: https://datasheet.ciiva.com/22653/1845221-22653354.pdf?src-supplier=Farnell; ComponentLink3URL: https://datasheet.ciiva.com/1508/1633692-1508723.pdf?src-supplier=Element14; ComponentLink3Description: https://datasheet.ciiva.com/1508/1633692-1508723.pdf?src-supplier=Element14; ComponentLink4URL: https://datasheet.ciiva.com/1899/txb0104-1899514.pdf?src-supplier=Digikey; ComponentLink4Description: https://datasheet.ciiva.com/1899/txb0104-1899514.pdf?src-supplier=Digikey; ComponentLink5URL: https://datasheet.ciiva.com/1899/txb0104-1899515.pdf?src-supplier=Digikey; ComponentLink5Description: https://datasheet.ciiva.com/1899/txb0104-1899515.pdf?src-supplier=Digikey; ComponentLink6URL: https://datasheet.ciiva.com/1899/txb0104-1899516.pdf?src-supplier=Digikey; ComponentLink6Description: https://datasheet.ciiva.com/1899/txb0104-1899516.pdf?src-supplier=Digikey; ComponentLink7URL: https://datasheet.ciiva.com/14287/txb0104-14287375.pdf?src-supplier=Avnet; ComponentLink7Description: https://datasheet.ciiva.com/14287/txb0104-14287375.pdf?src-supplier=Avnet; ComponentLink8URL: https://datasheet.ciiva.com/46395/1864432-46395886.pdf?src-supplier=Element14; ComponentLink8Description: https://datasheet.ciiva.com/46395/1864432-46395886.pdf?src-supplier=Element14; ComponentLink9URL: https://datasheet.ciiva.com/1508/1849862-1508724.pdf?src-supplier=Element14; ComponentLink9Description: https://datasheet.ciiva.com/1508/1849862-1508724.pdf?src-supplier=Element14; Package: 14-TSSOP; LCSC Part Number: C60708
U9 = MFFX-M2M UICC: E-SIM IC; Manufacturer: -; Manufacturer Part Number: MFFX-M2M UICC; Package: MFFX; Item Type: IC
U10 = SMF05CT1G-ES: 15V 5 Unidirectional 5V SOT-363 ESD Protection Devices ROHS; Manufacturer: ElecSuper; Item Type: ESD Diode; Manufacturer Part Number: SMF05CT1G-ES; Package: SOT-363; LCSC Part Number: C5180312; ComponentLink1Description: LCSC; ComponentLink1URL: https://www.lcsc.com/product-detail/ESD-Protection-Devices_ElecSuper-SMF05CT1G-ES_C5180312.html